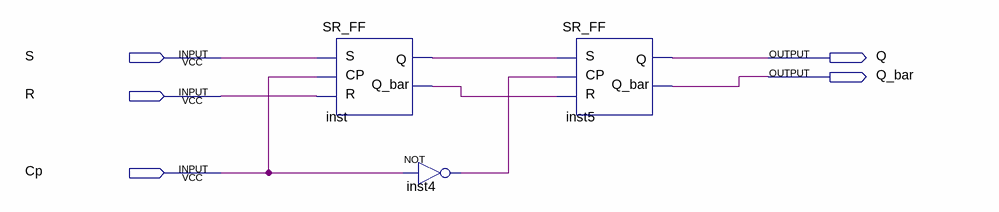
[diagram p0: schematic sheet]
// Quartus schematic MS_SR_FF.bdf as structural Verilog: 3 symbols, 5 pins
module MS_SR_FF (
  input  S,
  input  R,
  input  Cp,
  output Q,
  output Q_bar
);

  wire inst4_out, inst_q, inst_q_bar;

  SR_FF inst (.S(S), .R(R), .CP(Cp), .Q(inst_q), .Q_bar(inst_q_bar));
  not inst4 (inst4_out, Cp);
  SR_FF inst5 (.S(inst_q), .R(inst_q_bar), .CP(inst4_out), .Q(Q), .Q_bar(Q_bar));
endmodule
